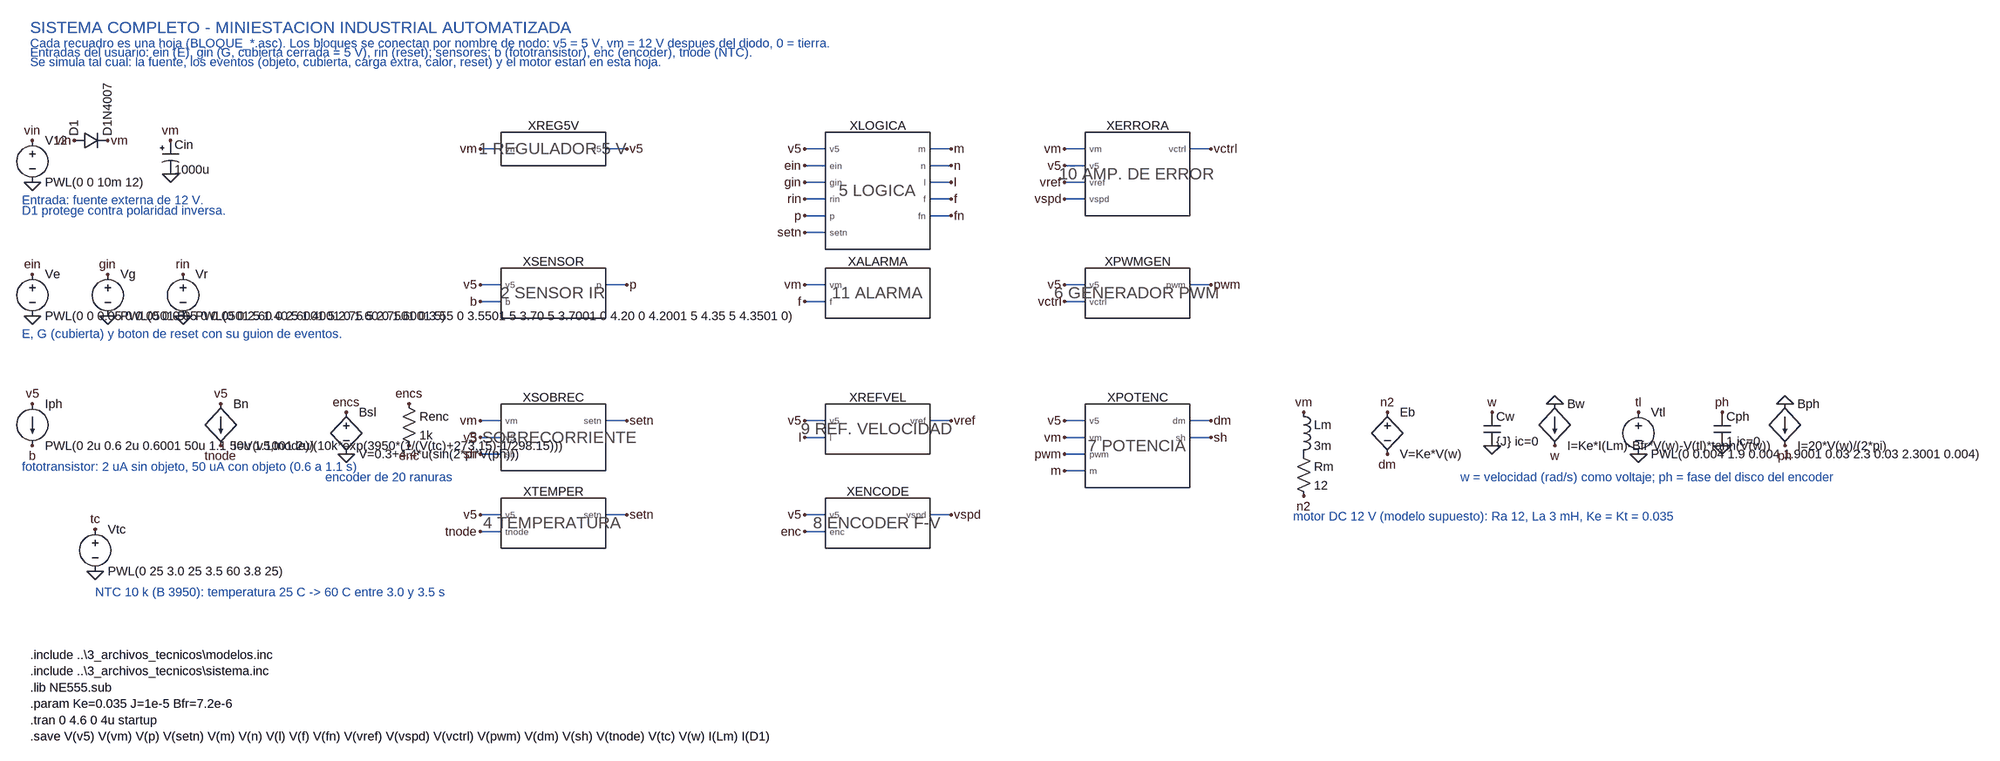
[diagram p0: schematic SISTEMA_JERARQUICO.asc]
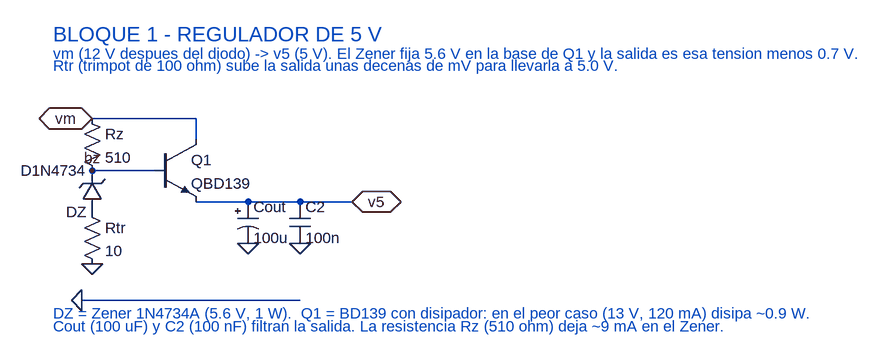
[diagram p1: sub-circuit bloque_reg5v.asc]
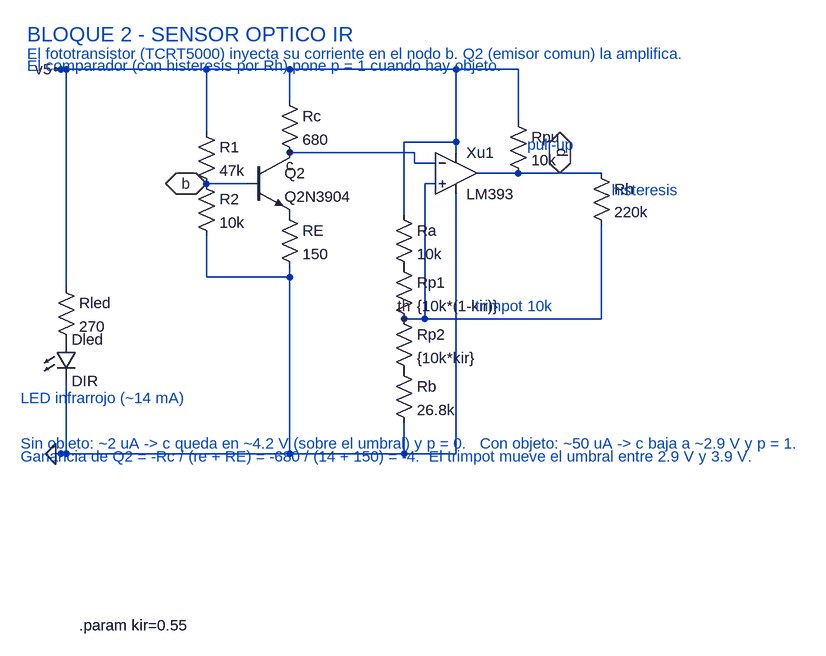
[diagram p2: sub-circuit bloque_sensor_ir.asc]
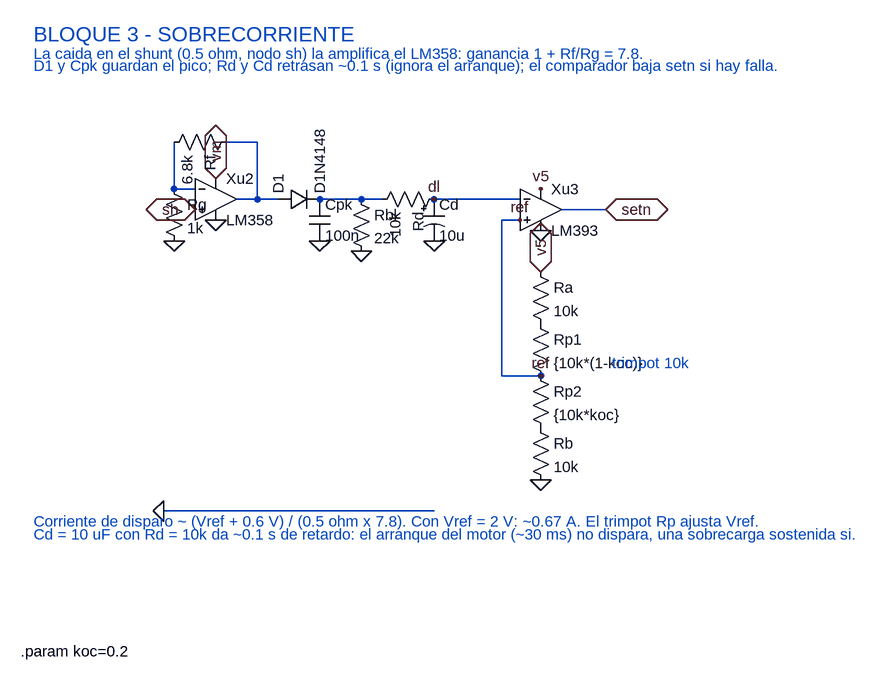
[diagram p3: sub-circuit bloque_sobrecorriente.asc]
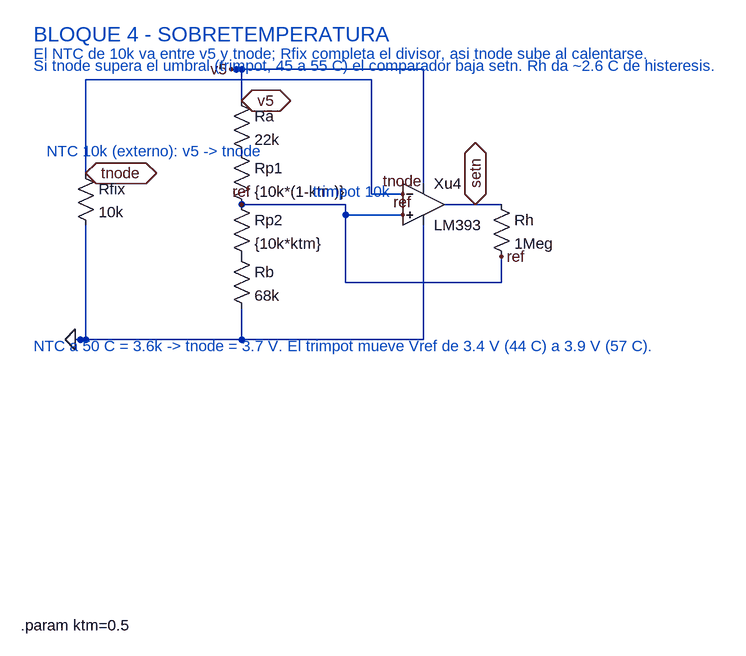
[diagram p4: sub-circuit bloque_temperatura.asc]
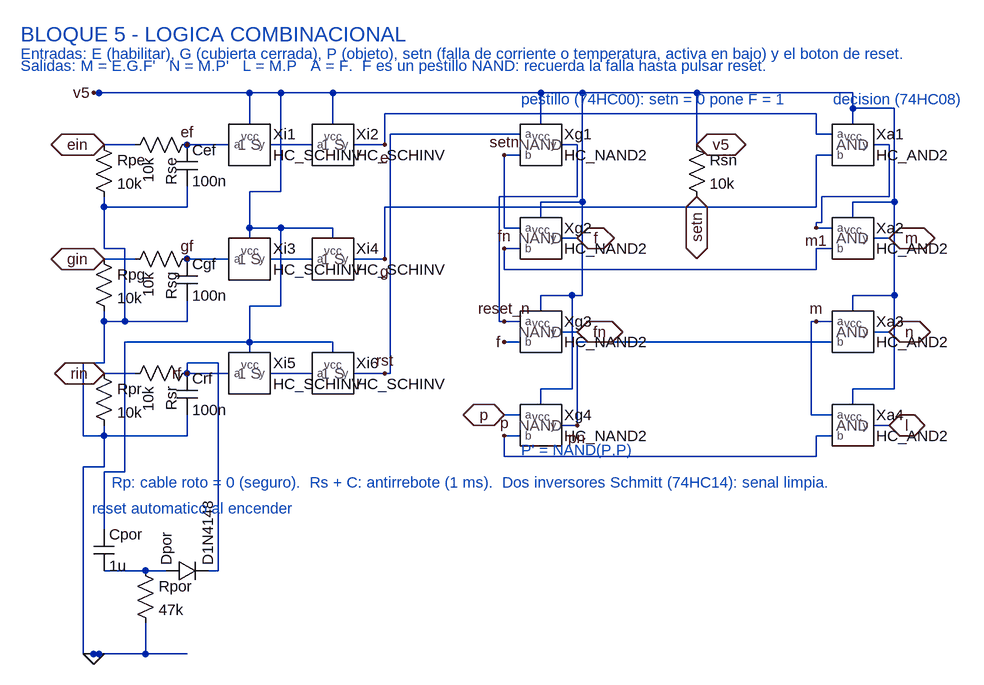
[diagram p5: sub-circuit bloque_logica.asc]
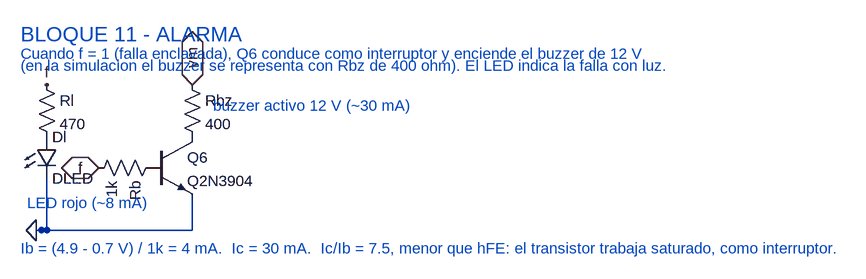
[diagram p6: sub-circuit bloque_alarma.asc]
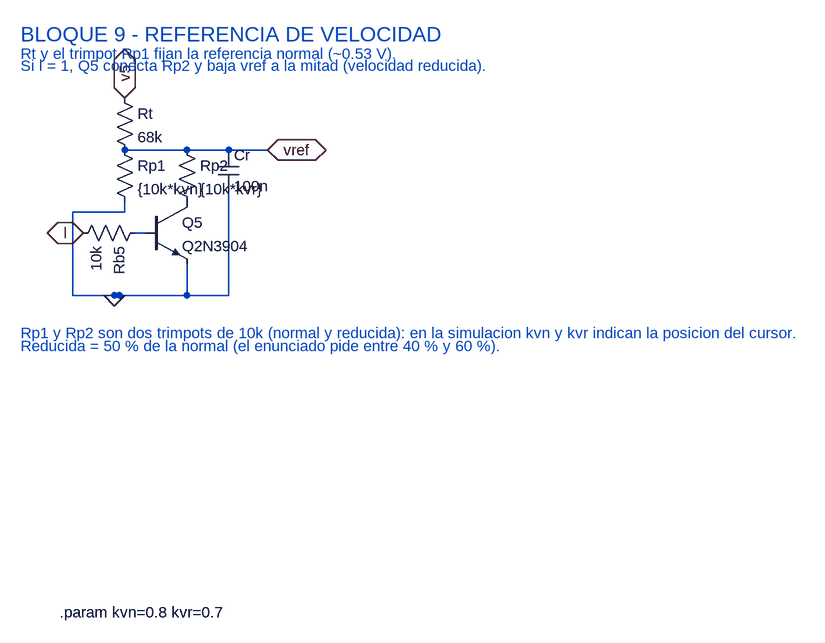
[diagram p7: sub-circuit bloque_refvel.asc]
SISTEMA_JERARQUICO.asc, the LTspice schematic file:
Version 4
SHEET 1 2400 1500
WIRE 0 32 -40 32
WIRE 200 32 240 32
WIRE 0 292 -40 292
WIRE 0 324 -40 324
WIRE 200 292 240 292
WIRE 0 552 -40 552
WIRE 0 584 -40 584
WIRE 0 616 -40 616
WIRE 200 552 240 552
WIRE 0 732 -40 732
WIRE 0 764 -40 764
WIRE 200 732 240 732
WIRE 620 32 580 32
WIRE 620 64 580 64
WIRE 620 96 580 96
WIRE 620 128 580 128
WIRE 620 160 580 160
WIRE 620 192 580 192
WIRE 820 32 860 32
WIRE 820 64 860 64
WIRE 820 96 860 96
WIRE 820 128 860 128
WIRE 820 160 860 160
WIRE 620 292 580 292
WIRE 620 324 580 324
WIRE 620 552 580 552
WIRE 620 584 580 584
WIRE 820 552 860 552
WIRE 620 732 580 732
WIRE 620 764 580 764
WIRE 820 732 860 732
WIRE 1240 32 1200 32
WIRE 1240 64 1200 64
WIRE 1240 96 1200 96
WIRE 1240 128 1200 128
WIRE 1440 32 1480 32
WIRE 1240 292 1200 292
WIRE 1240 324 1200 324
WIRE 1440 292 1480 292
WIRE 1240 552 1200 552
WIRE 1240 584 1200 584
WIRE 1240 616 1200 616
WIRE 1240 648 1200 648
WIRE 1440 552 1480 552
WIRE 1440 584 1480 584
FLAG -40 32 vm
FLAG 240 32 v5
FLAG -40 292 v5
FLAG -40 324 b
FLAG 240 292 p
FLAG -40 552 vm
FLAG -40 584 v5
FLAG -40 616 sh
FLAG 240 552 setn
FLAG -40 732 v5
FLAG -40 764 tnode
FLAG 240 732 setn
FLAG 580 32 v5
FLAG 580 64 ein
FLAG 580 96 gin
FLAG 580 128 rin
FLAG 580 160 p
FLAG 580 192 setn
FLAG 860 32 m
FLAG 860 64 n
FLAG 860 96 l
FLAG 860 128 f
FLAG 860 160 fn
FLAG 580 292 vm
FLAG 580 324 f
FLAG 580 552 v5
FLAG 580 584 l
FLAG 860 552 vref
FLAG 580 732 v5
FLAG 580 764 enc
FLAG 860 732 vspd
FLAG 1200 32 vm
FLAG 1200 64 v5
FLAG 1200 96 vref
FLAG 1200 128 vspd
FLAG 1480 32 vctrl
FLAG 1200 292 v5
FLAG 1200 324 vctrl
FLAG 1480 292 pwm
FLAG 1200 552 v5
FLAG 1200 584 vm
FLAG 1200 616 pwm
FLAG 1200 648 m
FLAG 1480 552 dm
FLAG 1480 584 sh
FLAG -896 16 vin
FLAG -896 96 0
FLAG -816 16 vin
FLAG -752 16 vm
FLAG -632 16 vm
FLAG -632 80 0
FLAG -896 272 ein
FLAG -896 352 0
FLAG -752 272 gin
FLAG -752 352 0
FLAG -608 272 rin
FLAG -608 352 0
FLAG -896 520 v5
FLAG -896 600 b
FLAG -776 760 tc
FLAG -776 840 0
FLAG -536 520 v5
FLAG -536 600 tnode
FLAG -296 536 encs
FLAG -296 616 0
FLAG -176 520 encs
FLAG -176 600 enc
FLAG 1696 536 vm
FLAG 1696 696 n2
FLAG 1856 536 n2
FLAG 1856 616 dm
FLAG 2056 536 w
FLAG 2056 600 0
FLAG 2176 520 0
FLAG 2176 600 w
FLAG 2336 536 tl
FLAG 2336 616 0
FLAG 2496 536 ph
FLAG 2496 600 0
FLAG 2616 520 0
FLAG 2616 600 ph
SYMBOL BLOQUE_REG5V 0 0 R0
SYMATTR InstName XREG5V
SYMBOL BLOQUE_SENSOR_IR 0 260 R0
SYMATTR InstName XSENSOR
SYMBOL BLOQUE_SOBRECORRIENTE 0 520 R0
SYMATTR InstName XSOBREC
SYMBOL BLOQUE_TEMPERATURA 0 700 R0
SYMATTR InstName XTEMPER
SYMBOL BLOQUE_LOGICA 620 0 R0
SYMATTR InstName XLOGICA
SYMBOL BLOQUE_ALARMA 620 260 R0
SYMATTR InstName XALARMA
SYMBOL BLOQUE_REFVEL 620 520 R0
SYMATTR InstName XREFVEL
SYMBOL BLOQUE_ENCODER_FV 620 700 R0
SYMATTR InstName XENCODE
SYMBOL BLOQUE_ERROR_AMP 1240 0 R0
SYMATTR InstName XERRORA
SYMBOL BLOQUE_PWM_GEN 1240 260 R0
SYMATTR InstName XPWMGEN
SYMBOL BLOQUE_POTENCIA 1240 520 R0
SYMATTR InstName XPOTENC
SYMBOL voltage -896 0 R0
SYMATTR InstName V12
SYMATTR Value PWL(0 0 10m 12)
SYMBOL diode -816 32 R270
SYMATTR InstName D1
SYMATTR Value D1N4007
SYMBOL polcap -648 16 R0
SYMATTR InstName Cin
SYMATTR Value 1000u
SYMBOL voltage -896 256 R0
SYMATTR InstName Ve
SYMATTR Value PWL(0 0 0.05 0 0.0501 5)
SYMBOL voltage -752 256 R0
SYMATTR InstName Vg
SYMATTR Value PWL(0 0 0.05 0 0.0501 5 1.40 5 1.4001 0 1.60 0 1.6001 5)
SYMBOL voltage -608 256 R0
SYMATTR InstName Vr
SYMATTR Value PWL(0 0 2.60 0 2.6001 5 2.75 5 2.7501 0 3.55 0 3.5501 5 3.70 5 3.7001 0 4.20 0 4.2001 5 4.35 5 4.3501 0)
SYMBOL current -896 520 R0
SYMATTR InstName Iph
SYMATTR Value PWL(0 2u 0.6 2u 0.6001 50u 1.1 50u 1.1001 2u)
SYMBOL voltage -776 744 R0
SYMATTR InstName Vtc
SYMATTR Value PWL(0 25 3.0 25 3.5 60 3.8 25)
SYMBOL bi -536 520 R0
SYMATTR InstName Bn
SYMATTR Value I=V(v5,tnode)/(10k*exp(3950*(1/(V(tc)+273.15)-1/298.15)))
SYMBOL bv -296 520 R0
SYMATTR InstName Bsl
SYMATTR Value V=0.3+4.4*u(sin(2*pi*V(ph)))
SYMBOL res -192 504 R0
SYMATTR InstName Renc
SYMATTR Value 1k
SYMBOL ind 1680 520 R0
SYMATTR InstName Lm
SYMATTR Value 3m
SYMBOL res 1680 600 R0
SYMATTR InstName Rm
SYMATTR Value 12
SYMBOL bv 1856 520 R0
SYMATTR InstName Eb
SYMATTR Value V=Ke*V(w)
SYMBOL cap 2040 536 R0
SYMATTR InstName Cw
SYMATTR Value {J} ic=0
SYMBOL bi 2176 520 R0
SYMATTR InstName Bw
SYMATTR Value I=Ke*I(Lm)-Bfr*V(w)-V(tl)*tanh(V(w))
SYMBOL voltage 2336 520 R0
SYMATTR InstName Vtl
SYMATTR Value PWL(0 0.004 1.9 0.004 1.9001 0.03 2.3 0.03 2.3001 0.004)
SYMBOL cap 2480 536 R0
SYMATTR InstName Cph
SYMATTR Value 1 ic=0
SYMBOL bi 2616 520 R0
SYMATTR InstName Bph
SYMATTR Value I=20*V(w)/(2*pi)
TEXT -900 -200 Left 3 ;SISTEMA COMPLETO - MINIESTACION INDUSTRIAL AUTOMATIZADA
TEXT -900 -170 Left 2 ;Cada recuadro es una hoja (BLOQUE_*.asc). Los bloques se conectan por nombre de nodo: v5 = 5 V, vm = 12 V despues del diodo, 0 = tierra.
TEXT -900 -152 Left 2 ;Entradas del usuario: ein (E), gin (G, cubierta cerrada = 5 V), rin (reset); sensores: b (fototransistor), enc (encoder), tnode (NTC).
TEXT -900 -134 Left 2 ;Se simula tal cual: la fuente, los eventos (objeto, cubierta, carga extra, calor, reset) y el motor estan en esta hoja.
TEXT -916 130 Left 2 ;Entrada: fuente externa de 12 V.
TEXT -916 150 Left 2 ;D1 protege contra polaridad inversa.
TEXT -916 386 Left 2 ;E, G (cubierta) y boton de reset con su guion de eventos.
TEXT -916 640 Left 2 ;fototransistor: 2 uA sin objeto, 50 uA con objeto (0.6 a 1.1 s)
TEXT -776 880 Left 2 ;NTC 10 k (B 3950): temperatura 25 C -> 60 C entre 3.0 y 3.5 s
TEXT -336 660 Left 2 ;encoder de 20 ranuras
TEXT 1676 735 Left 2 ;motor DC 12 V (modelo supuesto): Ra 12, La 3 mH, Ke = Kt = 0.035
TEXT 1996 660 Left 2 ;w = velocidad (rad/s) como voltaje; ph = fase del disco del encoder
TEXT -900 1000 Left 2 !.include ..\3_archivos_tecnicos\modelos.inc\n.include ..\3_archivos_tecnicos\sistema.inc\n.lib NE555.sub\n.param Ke=0.035 J=1e-5 Bfr=7.2e-6\n.tran 0 4.6 0 4u startup\n.save V(v5) V(vm) V(p) V(setn) V(m) V(n) V(l) V(f) V(fn) V(vref) V(vspd) V(vctrl) V(pwm) V(dm) V(sh) V(tnode) V(tc) V(w) I(Lm) I(D1)

bloque_reg5v.asc, the sub-circuit schematic file:
Version 4
SHEET 1 900 500
WIRE 0 80 96 80
WIRE 0 0 160 0
WIRE 160 0 160 32
WIRE 160 128 400 128
WIRE -16 280 320 280
FLAG 0 0 vm
FLAG 0 224 0
FLAG 0 80 bz
FLAG 400 128 v5
FLAG 240 192 0
FLAG 320 192 0
FLAG -16 280 0
IOPIN 0 0 BiDir
IOPIN 400 128 BiDir
SYMBOL res -16 -16 R0
SYMATTR InstName Rz
SYMATTR Value 510
SYMBOL zener 16 144 R180
SYMATTR InstName DZ
SYMATTR Value D1N4734
SYMBOL res -16 128 R0
SYMATTR InstName Rtr
SYMATTR Value 10
SYMBOL npn 96 32 R0
SYMATTR InstName Q1
SYMATTR Value QBD139
SYMBOL polcap 224 128 R0
SYMATTR InstName Cout
SYMATTR Value 100u
SYMBOL cap 304 128 R0
SYMATTR InstName C2
SYMATTR Value 100n
TEXT -60 -130 Left 3 ;BLOQUE 1 - REGULADOR DE 5 V
TEXT -60 -100 Left 2 ;vm (12 V despues del diodo) -> v5 (5 V). El Zener fija 5.6 V en la base de Q1 y la salida es esa tension menos 0.7 V.
TEXT -60 -82 Left 2 ;Rtr (trimpot de 100 ohm) sube la salida unas decenas de mV para llevarla a 5.0 V.
TEXT -60 300 Left 2 ;DZ = Zener 1N4734A (5.6 V, 1 W).  Q1 = BD139 con disipador: en el peor caso (13 V, 120 mA) disipa ~0.9 W.
TEXT -60 320 Left 2 ;Cout (100 uF) y C2 (100 nF) filtran la salida. La resistencia Rz (510 ohm) deja ~9 mA en el Zener.

bloque_sensor_ir.asc, the sub-circuit schematic file:
Version 4
SHEET 1 1100 700
WIRE 96 80 160 80
WIRE 224 32 416 32
WIRE 416 32 416 48
WIRE 416 48 448 48
WIRE 400 288 432 288
WIRE 432 288 432 80
WIRE 432 80 448 80
WIRE 512 64 576 64
WIRE 576 64 640 64
WIRE 640 64 704 64
WIRE 704 144 704 288
WIRE 704 288 432 288
WIRE -136 -96 576 -96
WIRE -136 -96 -128 -96
WIRE 224 -48 224 -96
WIRE 576 -16 576 -96
WIRE 96 0 96 -96
WIRE 480 32 480 -96
WIRE 400 128 400 16
WIRE 400 16 480 16
WIRE -120 240 -120 -96
WIRE -136 496 480 496
WIRE -136 496 -128 496
WIRE 400 448 400 496
WIRE -120 384 -120 496
WIRE 224 208 224 496
WIRE 96 160 96 224
WIRE 96 224 224 224
WIRE 480 96 480 496
FLAG 96 80 b
FLAG 224 32 c
FLAG 400 288 th
FLAG 640 64 p
FLAG -136 -96 v5
FLAG -136 496 0
IOPIN 96 80 BiDir
IOPIN 640 64 BiDir
SYMBOL res -136 224 R0
SYMATTR InstName Rled
SYMATTR Value 270
SYMBOL LED -136 320 R0
SYMATTR InstName Dled
SYMATTR Value DIR
SYMBOL res 80 -16 R0
SYMATTR InstName R1
SYMATTR Value 47k
SYMBOL res 80 64 R0
SYMATTR InstName R2
SYMATTR Value 10k
SYMBOL npn 160 32 R0
SYMATTR InstName Q2
SYMATTR Value Q2N3904
SYMBOL res 208 -64 R0
SYMATTR InstName Rc
SYMATTR Value 680
SYMBOL res 208 112 R0
SYMATTR InstName RE
SYMATTR Value 150
SYMBOL res 384 112 R0
SYMATTR InstName Ra
SYMATTR Value 10k
SYMBOL res 384 192 R0
SYMATTR InstName Rp1
SYMATTR Value {10k*(1-kir)}
SYMBOL res 384 272 R0
SYMATTR InstName Rp2
SYMATTR Value {10k*kir}
SYMBOL res 384 352 R0
SYMATTR InstName Rb
SYMATTR Value 26.8k
SYMBOL OpAmps\opamp2 480 0 R0
SYMATTR InstName Xu1
SYMATTR Value LM393
SYMBOL res 560 -32 R0
SYMATTR InstName Rpu
SYMATTR Value 10k
SYMBOL res 688 48 R0
SYMATTR InstName Rh
SYMATTR Value 220k
TEXT -180 -150 Left 3 ;BLOQUE 2 - SENSOR OPTICO IR
TEXT -180 -120 Left 2 ;El fototransistor (TCRT5000) inyecta su corriente en el nodo b. Q2 (emisor comun) la amplifica.
TEXT -180 -102 Left 2 ;El comparador (con histeresis por Rh) pone p = 1 cuando hay objeto.
TEXT -190 410 Left 2 ;LED infrarrojo (~14 mA)
TEXT 510 268 Left 2 ;trimpot 10k
TEXT 720 90 Left 2 ;histeresis
TEXT 590 20 Left 2 ;pull-up
TEXT -190 480 Left 2 ;Sin objeto: ~2 uA -> c queda en ~4.2 V (sobre el umbral) y p = 0.   Con objeto: ~50 uA -> c baja a ~2.9 V y p = 1.
TEXT -190 500 Left 2 ;Ganancia de Q2 = -Rc / (re + RE) = -680 / (14 + 150) = -4.  El trimpot mueve el umbral entre 2.9 V y 3.9 V.
TEXT -100 760 Left 2 !.param kir=0.55

bloque_sobrecorriente.asc, the sub-circuit schematic file:
Version 4
SHEET 1 1400 900
WIRE 168 48 136 48
WIRE 136 48 136 -24
WIRE 216 -24 264 -24
WIRE 264 -24 264 64
WIRE 264 64 232 64
WIRE 264 64 296 64
WIRE 360 64 424 64
WIRE 424 64 456 64
WIRE 536 64 668 64
WIRE 732 80 800 80
WIRE 700 336 640 336
WIRE 640 336 640 96
WIRE 640 96 668 96
WIRE 120 544 536 544
FLAG 168 80 sh
FLAG 200 32 vm
FLAG 200 96 0
FLAG 136 128 0
FLAG 360 128 0
FLAG 424 144 0
FLAG 536 128 0
FLAG 536 64 dl
FLAG 668 96 ref
FLAG 700 48 v5
FLAG 700 112 0
FLAG 800 80 setn
FLAG 700 176 v5
FLAG 700 336 ref
FLAG 700 496 0
FLAG 120 544 0
IOPIN 168 80 BiDir
IOPIN 200 32 BiDir
IOPIN 800 80 BiDir
IOPIN 700 176 BiDir
SYMBOL OpAmps\opamp2 200 0 R0
SYMATTR InstName Xu2
SYMATTR Value LM358
SYMBOL res 120 32 R0
SYMATTR InstName Rg
SYMATTR Value 1k
SYMBOL res 232 -40 R90
SYMATTR InstName Rf
SYMATTR Value 6.8k
SYMBOL diode 296 80 R270
SYMATTR InstName D1
SYMATTR Value D1N4148
SYMBOL cap 344 64 R0
SYMATTR InstName Cpk
SYMATTR Value 100n
SYMBOL res 408 48 R0
SYMATTR InstName Rbl
SYMATTR Value 22k
SYMBOL res 552 48 R90
SYMATTR InstName Rd
SYMATTR Value 10k
SYMBOL polcap 520 64 R0
SYMATTR InstName Cd
SYMATTR Value 10u
SYMBOL OpAmps\opamp2 700 16 R0
SYMATTR InstName Xu3
SYMATTR Value LM393
SYMBOL res 684 160 R0
SYMATTR InstName Ra
SYMATTR Value 10k
SYMBOL res 684 240 R0
SYMATTR InstName Rp1
SYMATTR Value {10k*(1-koc)}
SYMBOL res 684 320 R0
SYMATTR InstName Rp2
SYMATTR Value {10k*koc}
SYMBOL res 684 400 R0
SYMATTR InstName Rb
SYMATTR Value 10k
TEXT -80 -190 Left 3 ;BLOQUE 3 - SOBRECORRIENTE
TEXT -80 -160 Left 2 ;La caida en el shunt (0.5 ohm, nodo sh) la amplifica el LM358: ganancia 1 + Rf/Rg = 7.8.
TEXT -80 -142 Left 2 ;D1 y Cpk guardan el pico; Rd y Cd retrasan ~0.1 s (ignora el arranque); el comparador baja setn si hay falla.
TEXT 810 316 Left 2 ;trimpot 10k
TEXT -80 560 Left 2 ;Corriente de disparo ~ (Vref + 0.6 V) / (0.5 ohm x 7.8). Con Vref = 2 V: ~0.67 A. El trimpot Rp ajusta Vref.
TEXT -80 580 Left 2 ;Cd = 10 uF con Rd = 10k da ~0.1 s de retardo: el arranque del motor (~30 ms) no dispara, una sobrecarga sostenida si.
TEXT -100 760 Left 2 !.param koc=0.2

bloque_temperatura.asc, the sub-circuit schematic file:
Version 4
SHEET 1 1000 700
WIRE 552 112 600 112
WIRE 600 112 640 112
WIRE 0 64 0 -80
WIRE 0 -80 440 -80
WIRE 440 -80 440 96
WIRE 440 96 488 96
WIRE 240 112 400 112
WIRE 400 112 400 128
WIRE 400 128 488 128
WIRE 640 192 640 232
WIRE 640 232 400 232
WIRE 400 232 400 128
WIRE 224 -96 520 -96
WIRE 224 -96 232 -96
WIRE 240 -48 240 -96
WIRE 520 80 520 -96
WIRE -16 320 520 320
WIRE -16 320 -8 320
WIRE 240 272 240 320
WIRE 0 144 0 320
WIRE 520 144 520 320
FLAG 0 64 tnode
FLAG 240 -48 v5
FLAG 240 112 ref
FLAG 488 128 ref
FLAG 488 96 tnode
FLAG 600 112 setn
FLAG 640 192 ref
FLAG 224 -96 v5
FLAG -16 320 0
IOPIN 0 64 BiDir
IOPIN 240 -48 BiDir
IOPIN 600 112 BiDir
SYMBOL res -16 48 R0
SYMATTR InstName Rfix
SYMATTR Value 10k
SYMBOL res 224 -64 R0
SYMATTR InstName Ra
SYMATTR Value 22k
SYMBOL res 224 16 R0
SYMATTR InstName Rp1
SYMATTR Value {10k*(1-ktm)}
SYMBOL res 224 96 R0
SYMATTR InstName Rp2
SYMATTR Value {10k*ktm}
SYMBOL res 224 176 R0
SYMATTR InstName Rb
SYMATTR Value 68k
SYMBOL OpAmps\opamp2 520 48 R0
SYMATTR InstName Xu4
SYMATTR Value LM393
SYMBOL res 624 96 R0
SYMATTR InstName Rh
SYMATTR Value 1Meg
TEXT -80 -150 Left 3 ;BLOQUE 4 - SOBRETEMPERATURA
TEXT -80 -120 Left 2 ;El NTC de 10k va entre v5 y tnode; Rfix completa el divisor, asi tnode sube al calentarse.
TEXT -80 -102 Left 2 ;Si tnode supera el umbral (trimpot, 45 a 55 C) el comparador baja setn. Rh da ~2.6 C de histeresis.
TEXT -60 30 Left 2 ;NTC 10k (externo): v5 -> tnode
TEXT 350 92 Left 2 ;trimpot 10k
TEXT -80 330 Left 2 ;NTC a 50 C = 3.6k -> tnode = 3.7 V. El trimpot mueve Vref de 3.4 V (44 C) a 3.9 V (57 C).
TEXT -100 760 Left 2 !.param ktm=0.5

bloque_logica.asc, the sub-circuit schematic file:
Version 4
SHEET 1 1700 1000
WIRE 48 0 96 0
WIRE 176 0 240 0
WIRE 304 0 368 0
WIRE 432 0 480 0
WIRE 48 176 96 176
WIRE 176 176 240 176
WIRE 304 176 368 176
WIRE 432 176 480 176
WIRE 48 352 96 352
WIRE 176 352 240 352
WIRE 304 352 368 352
WIRE 432 352 480 352
WIRE 48 656 112 656
WIRE 112 656 144 656
WIRE 752 0 776 0
WIRE 720 -32 720 -56
WIRE 688 -16 664 -16
WIRE 688 16 664 16
WIRE 752 144 776 144
WIRE 720 112 720 88
WIRE 688 128 664 128
WIRE 688 160 664 160
WIRE 752 288 776 288
WIRE 720 256 720 232
WIRE 688 272 664 272
WIRE 688 304 664 304
WIRE 752 432 776 432
WIRE 720 400 720 376
WIRE 688 416 664 416
WIRE 688 448 664 448
WIRE 1232 0 1256 0
WIRE 1200 -32 1200 -56
WIRE 1168 -16 1144 -16
WIRE 1168 16 1144 16
WIRE 1232 144 1256 144
WIRE 1200 112 1200 88
WIRE 1168 128 1144 128
WIRE 1168 160 1144 160
WIRE 1232 288 1256 288
WIRE 1200 256 1200 232
WIRE 1168 272 1144 272
WIRE 1168 304 1144 304
WIRE 1232 432 1256 432
WIRE 1200 400 1200 376
WIRE 1168 416 1144 416
WIRE 1168 448 1144 448
WIRE 1144 -16 1144 -48
WIRE 1144 -48 480 -48
WIRE 480 -48 480 0
WIRE 1144 160 1144 192
WIRE 1144 192 664 192
WIRE 664 192 664 160
WIRE 1144 16 1144 96
WIRE 1144 96 480 96
WIRE 480 96 480 176
WIRE 1144 416 1136 416
WIRE 1136 416 1136 272
WIRE 1136 272 1144 272
WIRE 1256 0 1256 80
WIRE 1256 80 1152 80
WIRE 1152 80 1152 120
WIRE 1152 120 1144 120
WIRE 1144 120 1144 128
WIRE 1144 448 1144 480
WIRE 1144 480 664 480
WIRE 664 480 664 448
WIRE 1144 304 776 304
WIRE 776 304 776 432
WIRE 776 0 776 80
WIRE 776 80 656 80
WIRE 656 80 656 272
WIRE 656 272 664 272
WIRE 208 656 224 656
WIRE 224 656 224 336
WIRE 224 336 176 336
WIRE 176 336 176 352
WIRE 664 -16 488 -16
WIRE 488 -16 488 352
WIRE 488 352 480 352
WIRE 664 128 664 16
WIRE 32 -80 1200 -80
WIRE 32 -80 40 -80
WIRE 720 -56 720 -80
WIRE 1200 -56 1200 -80
WIRE 272 -32 272 -80
WIRE 400 -32 400 -80
WIRE 960 0 960 -80
WIRE 720 88 784 88
WIRE 784 88 784 -80
WIRE 1200 88 1264 88
WIRE 1264 88 1264 -56
WIRE 1264 -56 1200 -56
WIRE 720 232 784 232
WIRE 784 232 784 88
WIRE 1200 232 1264 232
WIRE 1264 232 1264 88
WIRE 720 376 768 376
WIRE 768 376 768 232
WIRE 1200 376 1264 376
WIRE 1264 376 1264 232
WIRE 272 144 272 72
WIRE 272 72 320 72
WIRE 320 72 320 -80
WIRE 400 144 400 128
WIRE 400 128 272 128
WIRE 272 320 272 248
WIRE 272 248 320 248
WIRE 320 248 320 128
WIRE 400 320 400 304
WIRE 400 304 272 304
WIRE 48 592 48 504
WIRE 48 504 80 504
WIRE 80 504 80 304
WIRE 80 304 272 304
WIRE 32 784 176 784
WIRE 32 784 40 784
WIRE 112 736 112 784
WIRE 48 432 48 496
WIRE 48 496 16 496
WIRE 16 496 16 784
WIRE 16 784 32 784
WIRE 176 416 176 448
WIRE 176 448 48 448
WIRE 48 256 48 336
WIRE 48 336 16 336
WIRE 16 336 16 448
WIRE 16 448 48 448
WIRE 176 240 176 272
WIRE 176 272 48 272
WIRE 48 80 48 160
WIRE 48 160 80 160
WIRE 80 160 80 272
WIRE 176 64 176 96
WIRE 176 96 48 96
FLAG 48 0 ein
FLAG 176 0 ef
FLAG 480 0 e
FLAG 48 176 gin
FLAG 176 176 gf
FLAG 480 176 g
FLAG 48 352 rin
FLAG 176 352 rf
FLAG 480 352 rst
FLAG 664 16 setn
FLAG 776 144 f
FLAG 664 160 fn
FLAG 776 288 fn
FLAG 664 272 reset_n
FLAG 664 304 f
FLAG 776 432 pn
FLAG 664 416 p
FLAG 664 448 p
FLAG 960 0 v5
FLAG 960 80 setn
FLAG 1256 144 m
FLAG 1144 128 m1
FLAG 1256 288 n
FLAG 1144 272 m
FLAG 1256 432 l
FLAG 32 -80 v5
FLAG 32 784 0
IOPIN 48 0 BiDir
IOPIN 48 176 BiDir
IOPIN 48 352 BiDir
IOPIN 776 144 BiDir
IOPIN 776 288 BiDir
IOPIN 664 416 BiDir
IOPIN 960 0 BiDir
IOPIN 960 80 BiDir
IOPIN 1256 144 BiDir
IOPIN 1256 288 BiDir
IOPIN 1256 432 BiDir
SYMBOL res 32 -16 R0
SYMATTR InstName Rpe
SYMATTR Value 10k
SYMBOL res 192 -16 R90
SYMATTR InstName Rse
SYMATTR Value 10k
SYMBOL cap 160 0 R0
SYMATTR InstName Cef
SYMATTR Value 100n
SYMBOL HC_SCHINV 272 0 R0
SYMATTR InstName Xi1
SYMATTR Value HC_SCHINV
SYMBOL HC_SCHINV 400 0 R0
SYMATTR InstName Xi2
SYMATTR Value HC_SCHINV
SYMBOL res 32 160 R0
SYMATTR InstName Rpg
SYMATTR Value 10k
SYMBOL res 192 160 R90
SYMATTR InstName Rsg
SYMATTR Value 10k
SYMBOL cap 160 176 R0
SYMATTR InstName Cgf
SYMATTR Value 100n
SYMBOL HC_SCHINV 272 176 R0
SYMATTR InstName Xi3
SYMATTR Value HC_SCHINV
SYMBOL HC_SCHINV 400 176 R0
SYMATTR InstName Xi4
SYMATTR Value HC_SCHINV
SYMBOL res 32 336 R0
SYMATTR InstName Rpr
SYMATTR Value 10k
SYMBOL res 192 336 R90
SYMATTR InstName Rsr
SYMATTR Value 10k
SYMBOL cap 160 352 R0
SYMATTR InstName Crf
SYMATTR Value 100n
SYMBOL HC_SCHINV 272 352 R0
SYMATTR InstName Xi5
SYMATTR Value HC_SCHINV
SYMBOL HC_SCHINV 400 352 R0
SYMATTR InstName Xi6
SYMATTR Value HC_SCHINV
SYMBOL cap 32 592 R0
SYMATTR InstName Cpor
SYMATTR Value 1u
SYMBOL res 96 640 R0
SYMATTR InstName Rpor
SYMATTR Value 47k
SYMBOL diode 144 672 R270
SYMATTR InstName Dpor
SYMATTR Value D1N4148
SYMBOL HC_NAND2 720 0 R0
SYMATTR InstName Xg1
SYMATTR Value HC_NAND2
SYMBOL HC_NAND2 720 144 R0
SYMATTR InstName Xg2
SYMATTR Value HC_NAND2
SYMBOL HC_NAND2 720 288 R0
SYMATTR InstName Xg3
SYMATTR Value HC_NAND2
SYMBOL HC_NAND2 720 432 R0
SYMATTR InstName Xg4
SYMATTR Value HC_NAND2
SYMBOL res 944 -16 R0
SYMATTR InstName Rsn
SYMATTR Value 10k
SYMBOL HC_AND2 1200 0 R0
SYMATTR InstName Xa1
SYMATTR Value HC_AND2
SYMBOL HC_AND2 1200 144 R0
SYMATTR InstName Xa2
SYMATTR Value HC_AND2
SYMBOL HC_AND2 1200 288 R0
SYMATTR InstName Xa3
SYMATTR Value HC_AND2
SYMBOL HC_AND2 1200 432 R0
SYMATTR InstName Xa4
SYMATTR Value HC_AND2
TEXT -80 -170 Left 3 ;BLOQUE 5 - LOGICA COMBINACIONAL
TEXT -80 -140 Left 2 ;Entradas: E (habilitar), G (cubierta cerrada), P (objeto), setn (falla de corriente o temperatura, activa en bajo) y el boton de reset.
TEXT -80 -122 Left 2 ;Salidas: M = E.G.F'   N = M.P'   L = M.P   A = F.  F es un pestillo NAND: recuerda la falla hasta pulsar reset.
TEXT 60 520 Left 2 ;Rp: cable roto = 0 (seguro).  Rs + C: antirrebote (1 ms).  Dos inversores Schmitt (74HC14): senal limpia.
TEXT 30 560 Left 2 ;reset automatico al encender
TEXT 690 -70 Left 2 ;pestillo (74HC00): setn = 0 pone F = 1
TEXT 690 470 Left 2 ;P' = NAND(P,P)
TEXT 1170 -70 Left 2 ;decision (74HC08)

bloque_alarma.asc, the sub-circuit schematic file:
Version 4
SHEET 1 800 500
WIRE -96 192 144 192
WIRE -96 192 -88 192
WIRE 144 144 144 192
WIRE -80 112 -80 192
FLAG 0 96 f
FLAG 144 -32 vm
FLAG -80 -32 f
FLAG -96 192 0
IOPIN 0 96 BiDir
IOPIN 144 -32 BiDir
SYMBOL res 96 80 R90
SYMATTR InstName Rb
SYMATTR Value 1k
SYMBOL npn 80 48 R0
SYMATTR InstName Q6
SYMATTR Value Q2N3904
SYMBOL res 128 -48 R0
SYMATTR InstName Rbz
SYMATTR Value 400
SYMBOL res -96 -48 R0
SYMATTR InstName Rl
SYMATTR Value 470
SYMBOL LED -96 48 R0
SYMATTR InstName Dl
SYMATTR Value DLED
TEXT -120 -110 Left 3 ;BLOQUE 11 - ALARMA
TEXT -120 -80 Left 2 ;Cuando f = 1 (falla enclavada), Q6 conduce como interruptor y enciende el buzzer de 12 V
TEXT -120 -62 Left 2 ;(en la simulacion el buzzer se representa con Rbz de 400 ohm). El LED indica la falla con luz.
TEXT 176 0 Left 2 ;buzzer activo 12 V (~30 mA)
TEXT -110 150 Left 2 ;LED rojo (~8 mA)
TEXT -120 220 Left 2 ;Ib = (4.9 - 0.7 V) / 1k = 4 mA.  Ic = 30 mA.  Ic/Ib = 7.5, menor que hFE: el transistor trabaja saturado, como interruptor.

bloque_refvel.asc, the sub-circuit schematic file:
Version 4
SHEET 1 900 600
WIRE 0 48 96 48
WIRE 96 48 160 48
WIRE 160 48 220 48
WIRE 16 176 32 176
WIRE -16 272 160 272
WIRE -16 272 -8 272
WIRE 96 224 96 272
WIRE 0 128 0 144
WIRE 0 144 -80 144
WIRE -80 144 -80 272
WIRE -80 272 -16 272
WIRE 160 112 160 272
FLAG 0 -32 v5
FLAG 220 48 vref
FLAG -64 176 l
FLAG -16 272 0
IOPIN 0 -32 BiDir
IOPIN 220 48 BiDir
IOPIN -64 176 BiDir
SYMBOL res -16 -48 R0
SYMATTR InstName Rt
SYMATTR Value 68k
SYMBOL res -16 32 R0
SYMATTR InstName Rp1
SYMATTR Value {10k*kvn}
SYMBOL res 80 32 R0
SYMATTR InstName Rp2
SYMATTR Value {10k*kvr}
SYMBOL npn 32 128 R0
SYMATTR InstName Q5
SYMATTR Value Q2N3904
SYMBOL res 32 160 R90
SYMATTR InstName Rb5
SYMATTR Value 10k
SYMBOL cap 144 48 R0
SYMATTR InstName Cr
SYMATTR Value 100n
TEXT -160 -130 Left 3 ;BLOQUE 9 - REFERENCIA DE VELOCIDAD
TEXT -160 -100 Left 2 ;Rt y el trimpot Rp1 fijan la referencia normal (~0.53 V).
TEXT -160 -82 Left 2 ;Si l = 1, Q5 conecta Rp2 y baja vref a la mitad (velocidad reducida).
TEXT -160 330 Left 2 ;Rp1 y Rp2 son dos trimpots de 10k (normal y reducida): en la simulacion kvn y kvr indican la posicion del cursor.
TEXT -160 350 Left 2 ;Reducida = 50 % de la normal (el enunciado pide entre 40 % y 60 %).
TEXT -100 760 Left 2 !.param kvn=0.8 kvr=0.7

bloque_encoder_fv.asc, the sub-circuit schematic file:
Version 4
SHEET 1 1700 800
WIRE 0 80 48 80
WIRE 48 80 48 48
WIRE 48 48 288 48
WIRE 224 192 256 192
WIRE 256 192 256 80
WIRE 256 80 288 80
WIRE 352 64 416 64
WIRE 416 64 480 64
WIRE 352 208 352 240
WIRE 352 240 256 240
WIRE 256 240 256 192
WIRE 544 64 608 64
WIRE 608 64 640 64
WIRE 640 64 640 80
WIRE 640 80 688 80
WIRE 912 80 944 80
WIRE 944 80 944 144
WIRE 944 144 912 144
WIRE 944 80 1008 80
WIRE 912 208 960 208
WIRE 1168 112 1128 112
WIRE 1232 112 1264 112
WIRE 1344 112 1376 112
WIRE 1456 112 1520 112
WIRE 416 64 416 112
WIRE 416 112 352 112
WIRE 352 112 352 128
WIRE 1128 112 1128 192
WIRE 1128 192 928 192
WIRE 928 192 928 256
WIRE 928 256 672 256
WIRE 672 256 672 144
WIRE 672 144 688 144
WIRE -136 -64 1200 -64
WIRE -136 -64 -128 -64
WIRE 416 -16 416 -64
WIRE 544 -16 544 -64
WIRE -120 0 -120 -64
WIRE 0 0 0 -64
WIRE 608 0 608 -64
WIRE 1008 0 1008 -64
WIRE 912 16 928 16
WIRE 928 16 928 -64
WIRE 320 32 320 -64
WIRE 1200 80 1200 -64
WIRE 224 112 224 -64
WIRE 688 208 664 208
WIRE 664 208 664 -64
WIRE -136 320 1456 320
WIRE -136 320 -128 320
WIRE 224 272 224 320
WIRE 960 272 960 320
WIRE 1344 176 1344 320
WIRE 1456 176 1456 192
WIRE 1456 192 1344 192
WIRE -120 144 -120 320
WIRE 1008 144 1008 320
WIRE 320 96 320 320
WIRE 688 16 656 16
WIRE 656 16 656 320
FLAG 0 0 v5
FLAG 0 80 enc
FLAG 224 192 eref
FLAG 352 128 eq
FLAG 352 208 eref
FLAG 544 64 tg
FLAG 688 144 mono
FLAG 1008 80 dis7
FLAG 1344 112 vf1
FLAG 1520 112 vspd
FLAG -136 -64 v5
FLAG -136 320 0
IOPIN 0 0 BiDir
IOPIN 0 80 BiDir
IOPIN 1520 112 BiDir
SYMBOL res -136 -16 R0
SYMATTR InstName Rled
SYMATTR Value 220
SYMBOL LED -136 80 R0
SYMATTR InstName Dled
SYMATTR Value DIR
SYMBOL res -16 -16 R0
SYMATTR InstName Rpe
SYMATTR Value 10k
SYMBOL OpAmps\opamp2 320 0 R0
SYMATTR InstName Xu7
SYMATTR Value LM393
SYMBOL res 208 96 R0
SYMATTR InstName Ru1
SYMATTR Value 10k
SYMBOL res 208 176 R0
SYMATTR InstName Ru2
SYMATTR Value 10k
SYMBOL res 400 -32 R0
SYMATTR InstName Rpq
SYMATTR Value 10k
SYMBOL res 336 112 R0
SYMATTR InstName Rhe
SYMATTR Value 1Meg
SYMBOL cap 544 48 R90
SYMATTR InstName Cd
SYMATTR Value 1n
SYMBOL res 528 -32 R0
SYMATTR InstName Rtg
SYMATTR Value 10k
SYMBOL diode 624 64 R180
SYMATTR InstName Dcl
SYMATTR Value D1N4148
SYMBOL Misc\NE555 800 112 R0
SYMATTR InstName X7
SYMATTR Value NE555
SYMBOL res 992 -16 R0
SYMATTR InstName Rt7
SYMATTR Value 20k
SYMBOL cap 992 80 R0
SYMATTR InstName Ct7
SYMATTR Value 10n
SYMBOL cap 944 208 R0
SYMATTR InstName Ccvm
SYMATTR Value 10n
SYMBOL HC_BUF 1200 112 R0
SYMATTR InstName Xb1
SYMATTR Value HC_BUF
SYMBOL res 1360 96 R90
SYMATTR InstName Rfv
SYMATTR Value 10k
SYMBOL cap 1328 112 R0
SYMATTR InstName Cfv
SYMATTR Value 1u
SYMBOL res 1472 96 R90
SYMATTR InstName Rfv2
SYMATTR Value 10k
SYMBOL cap 1440 112 R0
SYMATTR InstName Cfv2
SYMATTR Value 1u
TEXT -180 -150 Left 3 ;BLOQUE 8 - ENCODER Y CONVERTIDOR FRECUENCIA-VOLTAJE
TEXT -180 -120 Left 2 ;El fototransistor del optointerruptor (nodo enc, con pull-up Rpe) da pulsos al pasar las ranuras del disco. El comparador Xu7 los limpia.
TEXT -180 -102 Left 2 ;El 555 monoestable da un pulso fijo de 220 us por cada uno; el filtro RC doble lo vuelve voltaje: vspd = 1.1 mV por Hz.
TEXT -190 170 Left 2 ;LED del optointerruptor
TEXT -60 110 Left 2 ;fototransistor
TEXT -180 380 Left 2 ;tw = 1.1 x Rt7 x Ct7 = 1.1 x 20k x 10 nF = 220 us.  Vspd = 5 V x tw x f.  A 500 Hz: 0.55 V.
TEXT -180 400 Left 2 ;Dcl protege la entrada del 555 contra el pico positivo del derivador (Cd y Rtg dan un pulso corto en cada flanco de bajada).

bloque_error_amp.asc, the sub-circuit schematic file:
Version 4
SHEET 1 1500 900
WIRE 232 64 264 64
WIRE 264 64 264 128
WIRE 264 128 136 128
WIRE 136 128 136 48
WIRE 136 48 168 48
WIRE 232 272 264 272
WIRE 264 272 264 336
WIRE 264 336 136 336
WIRE 136 336 136 256
WIRE 136 256 168 256
WIRE 232 480 264 480
WIRE 264 480 264 544
WIRE 264 544 136 544
WIRE 136 544 136 464
WIRE 136 464 168 464
WIRE 0 480 64 480
WIRE 64 480 112 480
WIRE 112 480 112 496
WIRE 112 496 168 496
WIRE 480 256 704 256
WIRE 704 256 868 256
WIRE 480 320 704 320
WIRE 704 320 784 320
WIRE 784 320 836 320
WIRE 836 320 836 288
WIRE 836 288 868 288
WIRE 704 440 784 440
WIRE 784 440 784 320
WIRE 704 256 704 160
WIRE 784 160 960 160
WIRE 704 160 704 112
WIRE 768 112 960 112
WIRE 960 112 960 160
WIRE 960 160 960 272
WIRE 932 272 960 272
WIRE 960 272 980 272
WIRE 1060 272 1120 272
WIRE 704 360 704 344
WIRE 704 344 616 344
WIRE 616 344 616 480
WIRE 616 480 264 480
WIRE 400 320 272 320
WIRE 272 320 272 64
WIRE 272 64 264 64
WIRE 400 256 400 272
WIRE 400 272 264 272
WIRE 184 -64 200 -64
WIRE 184 -64 192 -64
WIRE 200 32 200 -64
WIRE 200 240 200 168
WIRE 200 168 152 168
WIRE 152 168 152 16
WIRE 152 16 200 16
WIRE 200 448 200 376
WIRE 200 376 152 376
WIRE 152 376 152 224
WIRE 152 224 200 224
WIRE -16 608 200 608
WIRE -16 608 -8 608
WIRE 0 560 0 608
WIRE 64 544 64 608
WIRE 200 512 200 608
WIRE 200 304 200 352
WIRE 200 352 248 352
WIRE 248 352 248 528
WIRE 248 528 200 528
WIRE 200 96 200 144
WIRE 200 144 248 144
WIRE 248 144 248 320
WIRE 248 320 200 320
FLAG 168 80 vref
FLAG 200 32 vm
FLAG 264 64 vrb
FLAG 168 288 vspd
FLAG 264 272 vsb
FLAG 168 496 voff
FLAG 264 480 vob
FLAG 0 400 v5
FLAG 0 480 voff
FLAG 900 240 vm
FLAG 900 304 0
FLAG 940 272 oa
FLAG 1060 336 0
FLAG 1120 272 vctrl
FLAG 184 -64 vm
FLAG -16 608 0
IOPIN 168 80 BiDir
IOPIN 200 32 BiDir
IOPIN 168 288 BiDir
IOPIN 0 400 BiDir
IOPIN 1120 272 BiDir
SYMBOL OpAmps\opamp2 200 0 R0
SYMATTR InstName Xbr
SYMATTR Value LM358
SYMBOL OpAmps\opamp2 200 208 R0
SYMATTR InstName Xbs
SYMATTR Value LM358
SYMBOL OpAmps\opamp2 200 416 R0
SYMATTR InstName Xbo
SYMATTR Value LM358
SYMBOL res -16 384 R0
SYMATTR InstName Rv1
SYMATTR Value 4.7k
SYMBOL res -16 464 R0
SYMATTR InstName Rv2
SYMATTR Value 5.1k
SYMBOL cap 48 480 R0
SYMATTR InstName Cv
SYMATTR Value 100n
SYMBOL res 496 240 R90
SYMATTR InstName R1
SYMATTR Value 10k
SYMBOL res 496 304 R90
SYMATTR InstName R3
SYMATTR Value 10k
SYMBOL res 688 344 R0
SYMATTR InstName R4
SYMATTR Value {Kerr*10k}
SYMBOL res 800 144 R90
SYMATTR InstName Rf6
SYMATTR Value {Kerr*10k}
SYMBOL cap 768 96 R90
SYMATTR InstName Cf6
SYMATTR Value 10n
SYMBOL OpAmps\opamp2 900 208 R0
SYMATTR InstName Xu2b
SYMATTR Value LM358
SYMBOL res 1076 256 R90
SYMATTR InstName Ro
SYMATTR Value 1k
SYMBOL cap 1044 272 R0
SYMATTR InstName Cvc
SYMATTR Value 100n
TEXT -220 -150 Left 3 ;BLOQUE 10 - AMPLIFICADOR DE ERROR (LAZO CERRADO)
TEXT -220 -120 Left 2 ;Tres seguidores (Xbr, Xbs, Xbo) aislan vref, la velocidad medida y el nivel Voff. Xu2b resta y multiplica por Kerr = 10:
TEXT -220 -102 Left 2 ;vctrl = Kerr (vref - vspd) + Voff. Si la velocidad baja, vctrl sube y el PWM da mas potencia al motor.
TEXT -220 640 Left 2 ;Kerr = 10: un error de 0.1 V mueve vctrl 1 V.  Voff = 2.6 V es el punto de partida (~55 % de PWM).
TEXT -220 660 Left 2 ;Un solo circuito integrado LM324 (cuatro amplificadores) contiene Xbr, Xbs, Xbo y Xu2b.
TEXT -100 760 Left 2 !.param Kerr=10

bloque_pwm_gen.asc, the sub-circuit schematic file:
Version 4
SHEET 1 1200 700
WIRE 408 128 500 128
WIRE 408 192 444 192
WIRE 444 192 444 208
WIRE 444 208 500 208
WIRE 408 256 460 256
WIRE 500 208 560 208
WIRE 560 208 668 208
WIRE 184 128 140 128
WIRE 140 128 140 360
WIRE 140 360 560 360
WIRE 560 360 560 208
WIRE 732 224 800 224
WIRE 800 224 860 224
WIRE 168 -16 800 -16
WIRE 168 -16 176 -16
WIRE 408 64 424 64
WIRE 424 64 424 -16
WIRE 800 144 800 -16
WIRE 184 256 168 256
WIRE 168 256 168 -16
FLAG 184 64 0
FLAG 184 128 tri
FLAG 184 192 tri_o
FLAG 500 48 v5
FLAG 500 272 0
FLAG 500 208 tri
FLAG 460 320 0
FLAG 460 256 cv
FLAG 668 240 vctrl
FLAG 700 192 v5
FLAG 700 256 0
FLAG 860 224 pwm
FLAG 168 -16 v5
IOPIN 668 240 BiDir
IOPIN 860 224 BiDir
SYMBOL Misc\NE555 296 160 R0
SYMATTR InstName X5
SYMATTR Value NE555
SYMBOL res 484 32 R0
SYMATTR InstName Ra5
SYMATTR Value 1k
SYMBOL res 484 112 R0
SYMATTR InstName Rb5
SYMATTR Value 10k
SYMBOL cap 484 208 R0
SYMATTR InstName Ct
SYMATTR Value 10n
SYMBOL cap 444 256 R0
SYMATTR InstName Ccv
SYMATTR Value 10n
SYMBOL OpAmps\opamp2 700 160 R0
SYMATTR InstName Xu6
SYMATTR Value LM393
SYMBOL res 784 128 R0
SYMATTR InstName Rpu
SYMATTR Value 10k
TEXT -100 -150 Left 3 ;BLOQUE 6 - GENERADOR DE PWM
TEXT -100 -120 Left 2 ;El NE555 oscila (~7 kHz): el nodo tri sube y baja entre 1.7 y 3.3 V (rampa).
TEXT -100 -102 Left 2 ;El comparador pone pwm = 1 mientras vctrl > tri: a mayor vctrl, pulsos mas anchos.
TEXT -100 420 Left 2 ;f = 1.44 / ((Ra5 + 2 Rb5) Ct) = 1.44 / (21k x 10 nF) = 6.9 kHz.   Ciclo de trabajo = (vctrl - 1.7 V) / 1.7 V: vctrl = 2.5 V da ~50 %.
TEXT -100 440 Left 2 ;El pin 3 del 555 (tri_o) no se usa: la rampa se toma del condensador Ct.

bloque_potencia.asc, the sub-circuit schematic file:
Version 4
SHEET 1 1200 800
WIRE 168 80 128 80
WIRE 168 112 128 112
WIRE 232 96 368 96
WIRE 368 48 368 96
WIRE 368 96 368 144
WIRE 432 96 480 96
WIRE 560 96 640 96
WIRE 688 16 800 16
WIRE 184 -96 432 -96
WIRE 184 -96 192 -96
WIRE 432 0 432 -96
WIRE 200 64 200 -96
WIRE 416 240 688 240
WIRE 416 240 424 240
WIRE 432 192 432 240
WIRE 688 192 688 240
WIRE 600 176 600 240
FLAG 128 80 pwm
FLAG 128 112 m
FLAG 600 96 gate
FLAG 688 16 dm
FLAG 688 112 sh
FLAG 800 -48 vm
FLAG 184 -96 v5
FLAG 416 240 0
IOPIN 128 80 BiDir
IOPIN 128 112 BiDir
IOPIN 688 16 BiDir
IOPIN 688 112 BiDir
IOPIN 800 -48 BiDir
SYMBOL HC_AND2 200 96 R0
SYMATTR InstName Xa5
SYMATTR Value HC_AND2
SYMBOL npn 368 0 R0
SYMATTR InstName Q3
SYMATTR Value Q2N3904
SYMBOL pnp 368 192 M180
SYMATTR InstName Q4
SYMATTR Value Q2N3906
SYMBOL res 576 80 R90
SYMATTR InstName Rg
SYMATTR Value 47
SYMBOL res 584 80 R0
SYMATTR InstName Rpd
SYMATTR Value 10k
SYMBOL nmos 640 16 R0
SYMATTR InstName M1
SYMATTR Value IRFZ44N_P
SYMBOL diode 816 16 R180
SYMATTR InstName Dfw
SYMATTR Value D1N5819
SYMBOL res 672 96 R0
SYMATTR InstName Rsh
SYMATTR Value 0.5
TEXT -80 -150 Left 3 ;BLOQUE 7 - SEGURIDAD, EXCITADOR Y MOSFET
TEXT -80 -120 Left 2 ;La compuerta AND deja pasar el PWM solo si M = 1: la seguridad manda sobre el PWM.
TEXT -80 -102 Left 2 ;Q3 y Q4 (seguidor complementario) cargan y descargan la compuerta de M1. Dfw protege contra el pico del motor.
TEXT -80 300 Left 2 ;El motor va entre vm y dm. Con M1 encendido la corriente baja por el motor, M1 y el shunt Rsh (0.5 ohm, 5 W).
TEXT -80 320 Left 2 ;Al apagar M1 el motor sigue empujando corriente: pasa por Dfw (Schottky 1N5819) de dm a vm.
TEXT -80 340 Left 2 ;M1 = IRFZ44N: con 4.3 V en la compuerta conduce con ~0.07 ohm (con 10 V seria 0.02). Rg limita la corriente de la compuerta.

The netlist it stands for:
* SISTEMA_JERARQUICO.asc
XXREG5V vm v5 bloque_reg5v
XXSENSOR v5 b p bloque_sensor_ir
XXSOBREC vm v5 sh setn bloque_sobrecorriente
XXTEMPER v5 tnode setn bloque_temperatura
XXLOGICA v5 ein gin rin p setn m n l f fn bloque_logica
XXALARMA vm f bloque_alarma
XXREFVEL v5 l vref bloque_refvel
XXENCODE v5 enc vspd bloque_encoder_fv
XXERRORA vm v5 vref vspd vctrl bloque_error_amp
XXPWMGEN v5 vctrl pwm bloque_pwm_gen
XXPOTENC v5 vm pwm m dm sh bloque_potencia
V12 vin 0 PWL(0 0 10m 12)
D1 vin vm D1N4007
Cin vm 0 1000u
Ve ein 0 PWL(0 0 0.05 0 0.0501 5)
Vg gin 0 PWL(0 0 0.05 0 0.0501 5 1.40 5 1.4001 0 1.60 0 1.6001 5)
Vr rin 0 PWL(0 0 2.60 0 2.6001 5 2.75 5 2.7501 0 3.55 0 3.5501 5 3.70 5 3.7001 0 4.20 0 4.2001 5 4.35 5 4.3501 0)
Iph v5 b PWL(0 2u 0.6 2u 0.6001 50u 1.1 50u 1.1001 2u)
Vtc tc 0 PWL(0 25 3.0 25 3.5 60 3.8 25)
Bn v5 tnode I=V(v5,tnode)/(10k*exp(3950*(1/(V(tc)+273.15)-1/298.15)))
Bsl encs 0 V=0.3+4.4*u(sin(2*pi*V(ph)))
Renc encs enc 1k
Lm vm P001 3m
Rm P001 n2 12
B§Eb n2 dm V=Ke*V(w)
Cw w 0 {J} ic=0
Bw 0 w I=Ke*I(Lm)-Bfr*V(w)-V(tl)*tanh(V(w))
Vtl tl 0 PWL(0 0.004 1.9 0.004 1.9001 0.03 2.3 0.03 2.3001 0.004)
Cph ph 0 1 ic=0
Bph 0 ph I=20*V(w)/(2*pi)

* block symbol definitions
.subckt bloque_reg5v vm v5
Rz vm bz 510
DZ P001 bz D1N4734
Rtr P001 0 10
Q1 vm bz v5 0 QBD139
Cout v5 0 100u
C2 v5 0 100n
* BLOQUE 1 - REGULADOR DE 5 V
* vm (12 V despues del diodo) -> v5 (5 V). El Zener fija 5.6 V en la base de Q1 y la salida es esa tension menos 0.7 V.
* Rtr (trimpot de 100 ohm) sube la salida unas decenas de mV para llevarla a 5.0 V.
* DZ = Zener 1N4734A (5.6 V, 1 W).  Q1 = BD139 con disipador: en el peor caso (13 V, 120 mA) disipa ~0.9 W.
* Cout (100 uF) y C2 (100 nF) filtran la salida. La resistencia Rz (510 ohm) deja ~9 mA en el Zener.
.ends bloque_reg5v

.subckt bloque_sensor_ir v5 b p
Rled v5 P001 270
Dled P001 0 DIR
R1 v5 b 47k
R2 b 0 10k
Q2 c b P002 0 Q2N3904
Rc v5 c 680
RE P002 0 150
Ra v5 P003 10k
Rp1 P003 th {10k*(1-kir)}
Rp2 th P004 {10k*kir}
Rb P004 0 26.8k
XXu1 th c v5 0 p LM393  ; pins In+ In- V+ V- OUT
Rpu v5 p 10k
Rh p th 220k
* BLOQUE 2 - SENSOR OPTICO IR
* El fototransistor (TCRT5000) inyecta su corriente en el nodo b. Q2 (emisor comun) la amplifica.
* El comparador (con histeresis por Rh) pone p = 1 cuando hay objeto.
* LED infrarrojo (~14 mA)
* trimpot 10k
* histeresis
* pull-up
* Sin objeto: ~2 uA -> c queda en ~4.2 V (sobre el umbral) y p = 0.   Con objeto: ~50 uA -> c baja a ~2.9 V y p = 1.
* Ganancia de Q2 = -Rc / (re + RE) = -680 / (14 + 150) = -4.  El trimpot mueve el umbral entre 2.9 V y 3.9 V.
.param kir=0.55
.ends bloque_sensor_ir

.subckt bloque_sobrecorriente vm v5 sh setn
XXu2 sh N001 vm 0 N002 LM358  ; pins In+ In- V+ V- OUT
Rg N001 0 1k
Rf N002 N001 6.8k
D1 N002 N003 D1N4148
Cpk N003 0 100n
Rbl N003 0 22k
Rd dl N003 10k
Cd dl 0 10u
XXu3 ref dl v5 0 setn LM393  ; pins In+ In- V+ V- OUT
Ra v5 P001 10k
Rp1 P001 ref {10k*(1-koc)}
Rp2 ref P002 {10k*koc}
Rb P002 0 10k
* BLOQUE 3 - SOBRECORRIENTE
* La caida en el shunt (0.5 ohm, nodo sh) la amplifica el LM358: ganancia 1 + Rf/Rg = 7.8.
* D1 y Cpk guardan el pico; Rd y Cd retrasan ~0.1 s (ignora el arranque); el comparador baja setn si hay falla.
* trimpot 10k
* Corriente de disparo ~ (Vref + 0.6 V) / (0.5 ohm x 7.8). Con Vref = 2 V: ~0.67 A. El trimpot Rp ajusta Vref.
* Cd = 10 uF con Rd = 10k da ~0.1 s de retardo: el arranque del motor (~30 ms) no dispara, una sobrecarga sostenida si.
.param koc=0.2
.ends bloque_sobrecorriente

.subckt bloque_temperatura v5 tnode setn
Rfix tnode 0 10k
Ra v5 P001 22k
Rp1 P001 ref {10k*(1-ktm)}
Rp2 ref P002 {10k*ktm}
Rb P002 0 68k
XXu4 ref tnode v5 0 setn LM393  ; pins In+ In- V+ V- OUT
Rh setn ref 1Meg
* BLOQUE 4 - SOBRETEMPERATURA
* El NTC de 10k va entre v5 y tnode; Rfix completa el divisor, asi tnode sube al calentarse.
* Si tnode supera el umbral (trimpot, 45 a 55 C) el comparador baja setn. Rh da ~2.6 C de histeresis.
* NTC 10k (externo): v5 -> tnode
* trimpot 10k
* NTC a 50 C = 3.6k -> tnode = 3.7 V. El trimpot mueve Vref de 3.4 V (44 C) a 3.9 V (57 C).
.param ktm=0.5
.ends bloque_temperatura

.subckt bloque_logica v5 ein gin rin p setn m n l f fn
Rpe ein 0 10k
Rse ef ein 10k
Cef ef 0 100n
XXi1 ef N001 v5 HC_SCHINV  ; pins a y vcc
XXi2 N001 e v5 HC_SCHINV  ; pins a y vcc
Rpg gin 0 10k
Rsg gf gin 10k
Cgf gf 0 100n
XXi3 gf N002 v5 HC_SCHINV  ; pins a y vcc
XXi4 N002 g v5 HC_SCHINV  ; pins a y vcc
Rpr rin 0 10k
Rsr rf rin 10k
Crf rf 0 100n
XXi5 rf N003 v5 HC_SCHINV  ; pins a y vcc
XXi6 N003 rst v5 HC_SCHINV  ; pins a y vcc
Cpor v5 N004 1u
Rpor N004 0 47k
Dpor N004 rf D1N4148
XXg1 rst setn reset_n v5 HC_NAND2  ; pins a b y vcc
XXg2 setn fn f v5 HC_NAND2  ; pins a b y vcc
XXg3 reset_n f fn v5 HC_NAND2  ; pins a b y vcc
XXg4 p p pn v5 HC_NAND2  ; pins a b y vcc
Rsn v5 setn 10k
XXa1 e g m1 v5 HC_AND2  ; pins a b y vcc
XXa2 m1 fn m v5 HC_AND2  ; pins a b y vcc
XXa3 m pn n v5 HC_AND2  ; pins a b y vcc
XXa4 m p l v5 HC_AND2  ; pins a b y vcc
* BLOQUE 5 - LOGICA COMBINACIONAL
* Entradas: E (habilitar), G (cubierta cerrada), P (objeto), setn (falla de corriente o temperatura, activa en bajo) y el boton de reset.
* Salidas: M = E.G.F'   N = M.P'   L = M.P   A = F.  F es un pestillo NAND: recuerda la falla hasta pulsar reset.
* Rp: cable roto = 0 (seguro).  Rs + C: antirrebote (1 ms).  Dos inversores Schmitt (74HC14): senal limpia.
* reset automatico al encender
* pestillo (74HC00): setn = 0 pone F = 1
* P' = NAND(P,P)
* decision (74HC08)
.ends bloque_logica

.subckt bloque_alarma vm f
Rb P001 f 1k
Q6 P002 P001 0 0 Q2N3904
Rbz vm P002 400
Rl f P003 470
Dl P003 0 DLED
* BLOQUE 11 - ALARMA
* Cuando f = 1 (falla enclavada), Q6 conduce como interruptor y enciende el buzzer de 12 V
* (en la simulacion el buzzer se representa con Rbz de 400 ohm). El LED indica la falla con luz.
* buzzer activo 12 V (~30 mA)
* LED rojo (~8 mA)
* Ib = (4.9 - 0.7 V) / 1k = 4 mA.  Ic = 30 mA.  Ic/Ib = 7.5, menor que hFE: el transistor trabaja saturado, como interruptor.
.ends bloque_alarma

.subckt bloque_refvel v5 l vref
Rt v5 vref 68k
Rp1 vref 0 {10k*kvn}
Rp2 vref P001 {10k*kvr}
Q5 P001 N001 0 0 Q2N3904
Rb5 N001 l 10k
Cr vref 0 100n
* BLOQUE 9 - REFERENCIA DE VELOCIDAD
* Rt y el trimpot Rp1 fijan la referencia normal (~0.53 V).
* Si l = 1, Q5 conecta Rp2 y baja vref a la mitad (velocidad reducida).
* Rp1 y Rp2 son dos trimpots de 10k (normal y reducida): en la simulacion kvn y kvr indican la posicion del cursor.
* Reducida = 50 % de la normal (el enunciado pide entre 40 % y 60 %).
.param kvn=0.8 kvr=0.7
.ends bloque_refvel

.subckt bloque_encoder_fv v5 enc vspd
Rled v5 P001 220
Dled P001 0 DIR
Rpe v5 enc 10k
XXu7 eref enc v5 0 eq LM393  ; pins In+ In- V+ V- OUT
Ru1 v5 eref 10k
Ru2 eref 0 10k
Rpq v5 eq 10k
Rhe eq eref 1Meg
Cd tg eq 1n
Rtg v5 tg 10k
Dcl tg v5 D1N4148
XX7 0 tg mono v5 N001 dis7 dis7 v5 NE555  ; pins GND TRIG OUT RST CV THRS DIS Vcc
Rt7 v5 dis7 20k
Ct7 dis7 0 10n
Ccvm N001 0 10n
XXb1 mono N002 v5 HC_BUF  ; pins a y vcc
Rfv vf1 N002 10k
Cfv vf1 0 1u
Rfv2 vspd vf1 10k
Cfv2 vspd 0 1u
* BLOQUE 8 - ENCODER Y CONVERTIDOR FRECUENCIA-VOLTAJE
* El fototransistor del optointerruptor (nodo enc, con pull-up Rpe) da pulsos al pasar las ranuras del disco. El comparador Xu7 los limpia.
* El 555 monoestable da un pulso fijo de 220 us por cada uno; el filtro RC doble lo vuelve voltaje: vspd = 1.1 mV por Hz.
* LED del optointerruptor
* fototransistor
* tw = 1.1 x Rt7 x Ct7 = 1.1 x 20k x 10 nF = 220 us.  Vspd = 5 V x tw x f.  A 500 Hz: 0.55 V.
* Dcl protege la entrada del 555 contra el pico positivo del derivador (Cd y Rtg dan un pulso corto en cada flanco de bajada).
.ends bloque_encoder_fv

.subckt bloque_error_amp vm v5 vref vspd vctrl
XXbr vref vrb vm 0 vrb LM358  ; pins In+ In- V+ V- OUT
XXbs vspd vsb vm 0 vsb LM358  ; pins In+ In- V+ V- OUT
XXbo voff vob vm 0 vob LM358  ; pins In+ In- V+ V- OUT
Rv1 v5 voff 4.7k
Rv2 voff 0 5.1k
Cv voff 0 100n
R1 N001 vsb 10k
R3 N002 vrb 10k
R4 vob N002 {Kerr*10k}
Rf6 oa N001 {Kerr*10k}
Cf6 oa N001 10n
XXu2b N002 N001 vm 0 oa LM358  ; pins In+ In- V+ V- OUT
Ro vctrl oa 1k
Cvc vctrl 0 100n
* BLOQUE 10 - AMPLIFICADOR DE ERROR (LAZO CERRADO)
* Tres seguidores (Xbr, Xbs, Xbo) aislan vref, la velocidad medida y el nivel Voff. Xu2b resta y multiplica por Kerr = 10:
* vctrl = Kerr (vref - vspd) + Voff. Si la velocidad baja, vctrl sube y el PWM da mas potencia al motor.
* Kerr = 10: un error de 0.1 V mueve vctrl 1 V.  Voff = 2.6 V es el punto de partida (~55 % de PWM).
* Un solo circuito integrado LM324 (cuatro amplificadores) contiene Xbr, Xbs, Xbo y Xu2b.
.param Kerr=10
.ends bloque_error_amp

.subckt bloque_pwm_gen v5 vctrl pwm
XX5 0 tri tri_o v5 cv tri N001 v5 NE555  ; pins GND TRIG OUT RST CV THRS DIS Vcc
Ra5 v5 N001 1k
Rb5 N001 tri 10k
Ct tri 0 10n
Ccv cv 0 10n
XXu6 vctrl tri v5 0 pwm LM393  ; pins In+ In- V+ V- OUT
Rpu v5 pwm 10k
* BLOQUE 6 - GENERADOR DE PWM
* El NE555 oscila (~7 kHz): el nodo tri sube y baja entre 1.7 y 3.3 V (rampa).
* El comparador pone pwm = 1 mientras vctrl > tri: a mayor vctrl, pulsos mas anchos.
* f = 1.44 / ((Ra5 + 2 Rb5) Ct) = 1.44 / (21k x 10 nF) = 6.9 kHz.   Ciclo de trabajo = (vctrl - 1.7 V) / 1.7 V: vctrl = 2.5 V da ~50 %.
* El pin 3 del 555 (tri_o) no se usa: la rampa se toma del condensador Ct.
.ends bloque_pwm_gen

.subckt bloque_potencia v5 vm pwm m dm sh
XXa5 pwm m N001 v5 HC_AND2  ; pins a b y vcc
Q3 v5 N001 N002 0 Q2N3904
Q4 0 N001 N002 0 Q2N3906
Rg gate N002 47
Rpd gate 0 10k
M1 dm gate sh sh IRFZ44N_P
Dfw dm vm D1N5819
Rsh sh 0 0.5
* BLOQUE 7 - SEGURIDAD, EXCITADOR Y MOSFET
* La compuerta AND deja pasar el PWM solo si M = 1: la seguridad manda sobre el PWM.
* Q3 y Q4 (seguidor complementario) cargan y descargan la compuerta de M1. Dfw protege contra el pico del motor.
* El motor va entre vm y dm. Con M1 encendido la corriente baja por el motor, M1 y el shunt Rsh (0.5 ohm, 5 W).
* Al apagar M1 el motor sigue empujando corriente: pasa por Dfw (Schottky 1N5819) de dm a vm.
* M1 = IRFZ44N: con 4.3 V en la compuerta conduce con ~0.07 ohm (con 10 V seria 0.02). Rg limita la corriente de la compuerta.
.ends bloque_potencia

.model D D
.lib standard.dio
.model NPN NPN
.model PNP PNP
.lib standard.bjt
.model NMOS NMOS
.model PMOS PMOS
.lib standard.mos
* SISTEMA COMPLETO - MINIESTACION INDUSTRIAL AUTOMATIZADA
* Cada recuadro es una hoja (BLOQUE_*.asc). Los bloques se conectan por nombre de nodo: v5 = 5 V, vm = 12 V despues del diodo, 0 = tierra.
* Entradas del usuario: ein (E), gin (G, cubierta cerrada = 5 V), rin (reset); sensores: b (fototransistor), enc (encoder), tnode (NTC).
* Se simula tal cual: la fuente, los eventos (objeto, cubierta, carga extra, calor, reset) y el motor estan en esta hoja.
* Entrada: fuente externa de 12 V.
* D1 protege contra polaridad inversa.
* E, G (cubierta) y boton de reset con su guion de eventos.
* fototransistor: 2 uA sin objeto, 50 uA con objeto (0.6 a 1.1 s)
* NTC 10 k (B 3950): temperatura 25 C -> 60 C entre 3.0 y 3.5 s
* encoder de 20 ranuras
* motor DC 12 V (modelo supuesto): Ra 12, La 3 mH, Ke = Kt = 0.035
* w = velocidad (rad/s) como voltaje; ph = fase del disco del encoder
.include ..\3_archivos_tecnicos\modelos.inc
.include ..\3_archivos_tecnicos\sistema.inc
.lib NE555.sub
.param Ke=0.035 J=1e-5 Bfr=7.2e-6
.tran 0 4.6 0 4u startup
.save V(v5) V(vm) V(p) V(setn) V(m) V(n) V(l) V(f) V(fn) V(vref) V(vspd) V(vctrl) V(pwm) V(dm) V(sh) V(tnode) V(tc) V(w) I(Lm) I(D1)
.lib NE555.sub
.backanno
.end